# Altium schematic sheet S56_MLD_tiny_Ambient_Light_Sensor.SchDoc
size A4; SheetNumber: 4; SheetTotal: 4
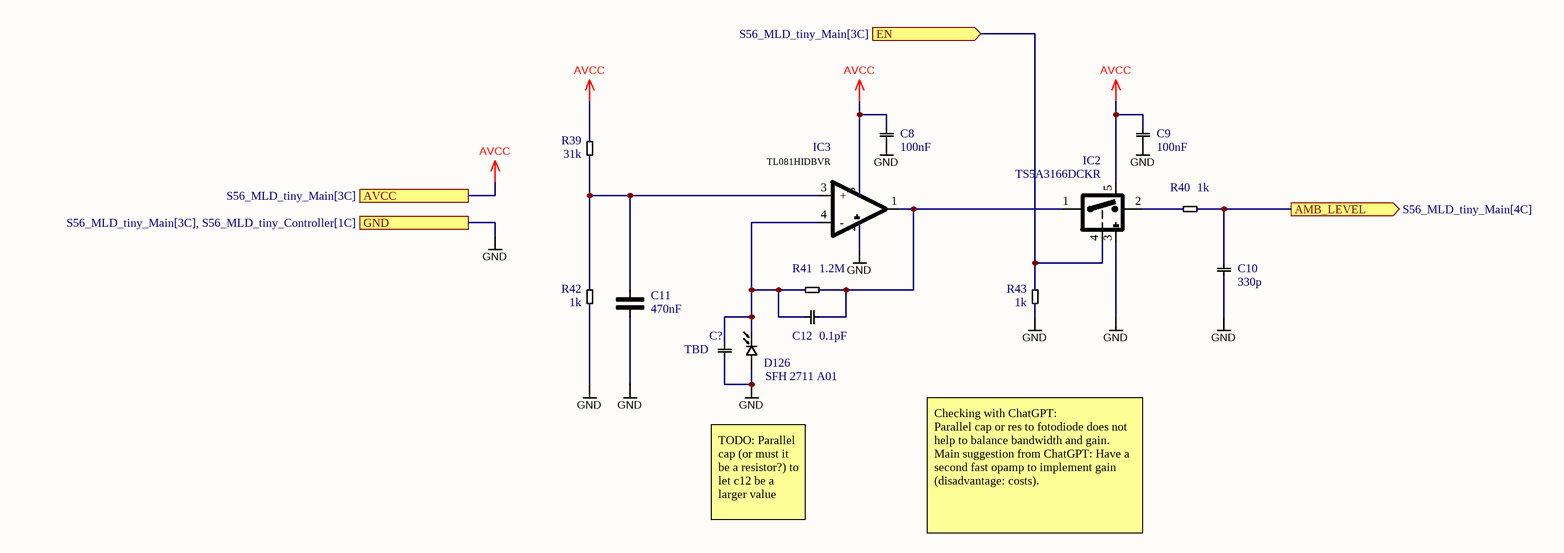
[diagram p0: S56_MLD_tiny_Ambient_Light_Sensor.SchDoc]

## Parts
C8  100nF  [C0402G]
C9  100nF  [C0402G]
C10  330p  [C0402G]
C11  470nF  [C0603G]
C12  0.1pF  [C0402G]
C?  TBD  [C0402G]
D126  SFH 2711 A01  [D0805G]
IC2  TS5A3166DCKR  [SOT-353G]
IC3  TL081HIDBVR  [SOT-23-5G]
R39  31k  [R0402G]
R40  1k  [R0402G]
R41  1.2M  [R0402G]
R42  1k  [R0402G]
R43  1k  [R0402G]

## Ports
AMB_LEVEL (out, see S56_MLD_tiny_Main[4C]), AVCC (see S56_MLD_tiny_Main[3C]), EN (in, see S56_MLD_tiny_Main[3C]), GND (see S56_MLD_tiny_Main[3C], S56_MLD_tiny_Controller[1C])

## Nets
AVCC: C8.2 C9.2 IC2.5(Vdd) IC3.5(Vdd) R39.2 ; port AVCC
GND: C8.1 C9.1 C10.1 C11.1 C?.1 D126.2(A) IC2.3(GND) IC3.2(Vss) R42.1 R43.1 ; port GND
AMB_LEVEL: C10.2 R40.1 ; port AMB_LEVEL
EN: IC2.4(B) R43.2 ; port EN
NetC11_2: C11.2 IC3.3(+) R39.1 R42.2
NetC12_1: C12.1 IC2.1(XA) IC3.1(OUT) R41.1
NetC12_2: C12.2 C?.2 D126.1(K) IC3.4(-) R41.2
NetIC2_2: IC2.2(YA) R40.2

## Notes on the sheet
- TODO: Parallel cap (or must it be a resistor?) to let c12 be a larger value
- Checking with ChatGPT:
  Parallel cap or res to fotodiode does not help to balance bandwidth and gain.
  Main suggestion from ChatGPT: Have a second fast opamp to implement gain (disadvantage: costs).

## Library data of the parts
C8-C10 C12 C? = CAP10: Capacitor, unipolar
  C8 C9: Value: 100nF
  C10: Value: 330p
  C12: Value: 0.1pF
  C?: Value: TBD
C11 = CAP20L: Capacitor, unipolar; Part: KAM15BR71E474KT; Manufacturer: KYOCERA AVX; Value: 470nF; Digikey: 478-KAM15BR71E474KTCT-ND
D126 = PHOTO_DIODE: Photo Diode; Part: SFH 2711 A01; Digikey: 475-SFH2711A01CT-ND
IC2 = 74VHC1G66: Single Pole Single Throw bidirectional analog switch, normally open; Part: TS5A3166DCKR; Digikey: 296-17741-1-ND
IC3 = MCP6001: MCP6001, or LPV7215; DigiKey: 296-TL081HIDBVRCT-ND; Part: TL081HIDBVR
R39-R43 = RES10_: Resistor
  R39: Value: 31k
  R40 R42 R43: Value: 1k
  R41: Value: 1.2M